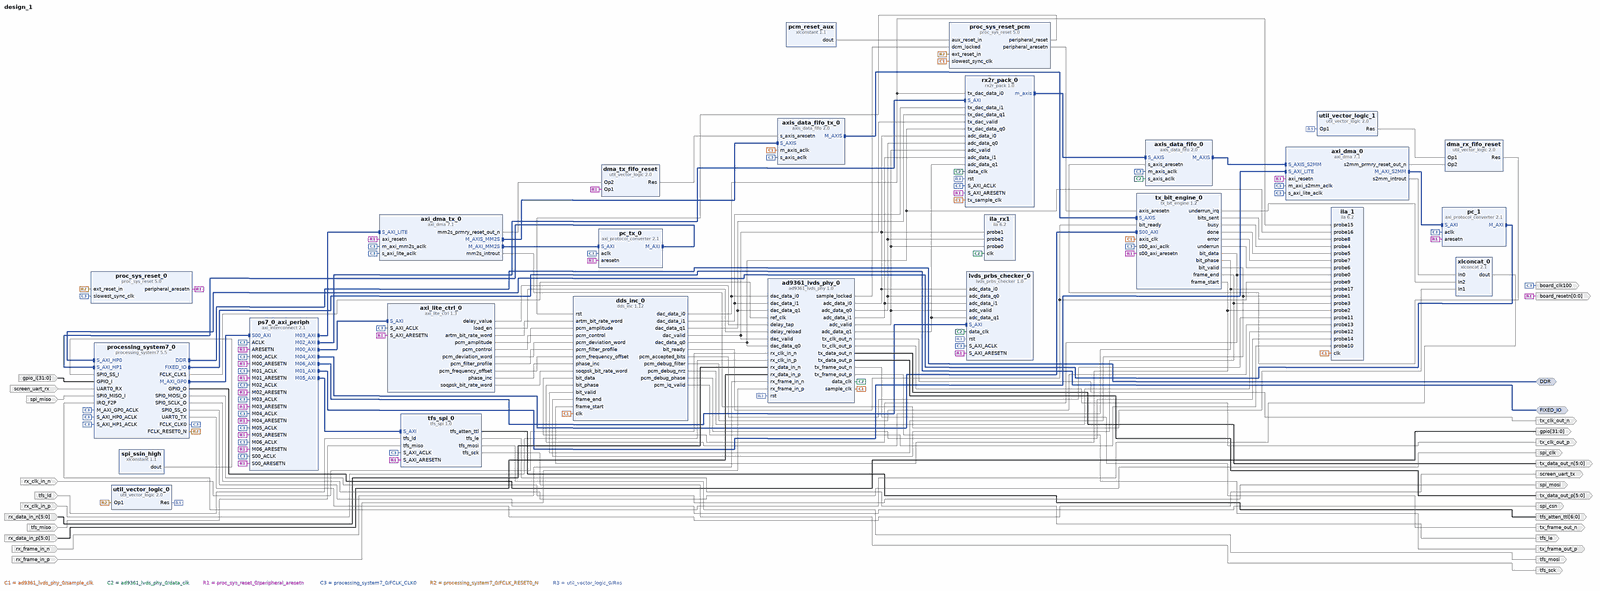
[diagram p0: block diagram of the top level, whole]
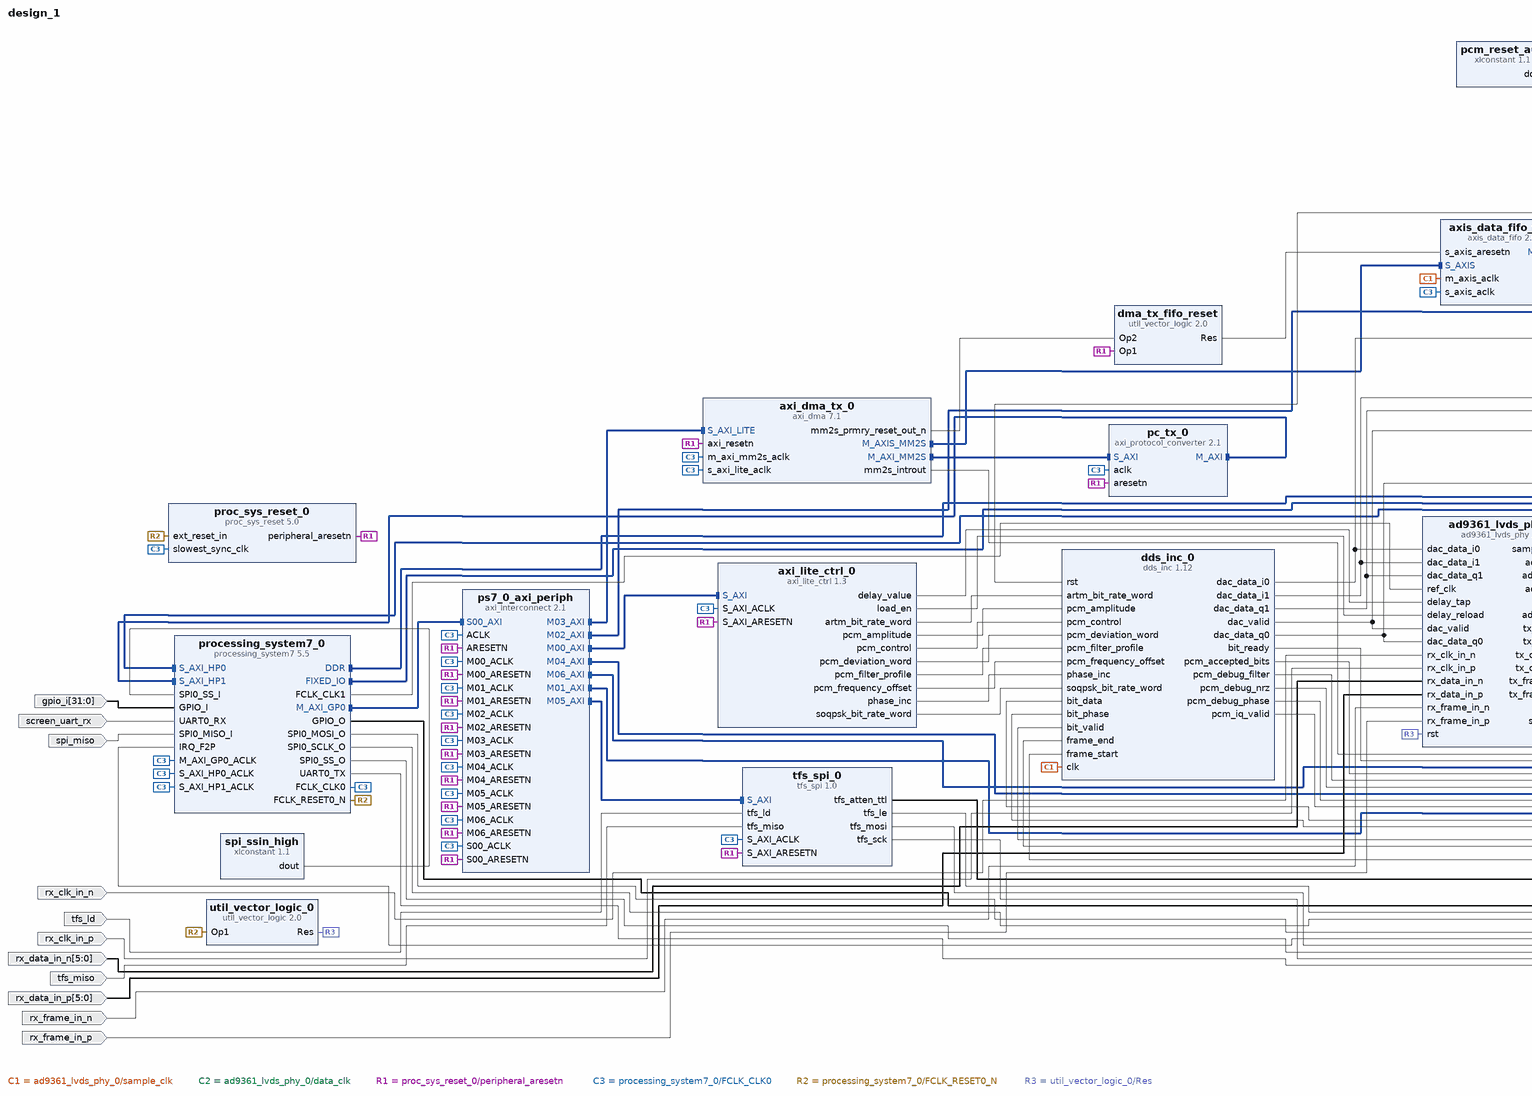
[diagram p1: block diagram of the top level, left part]
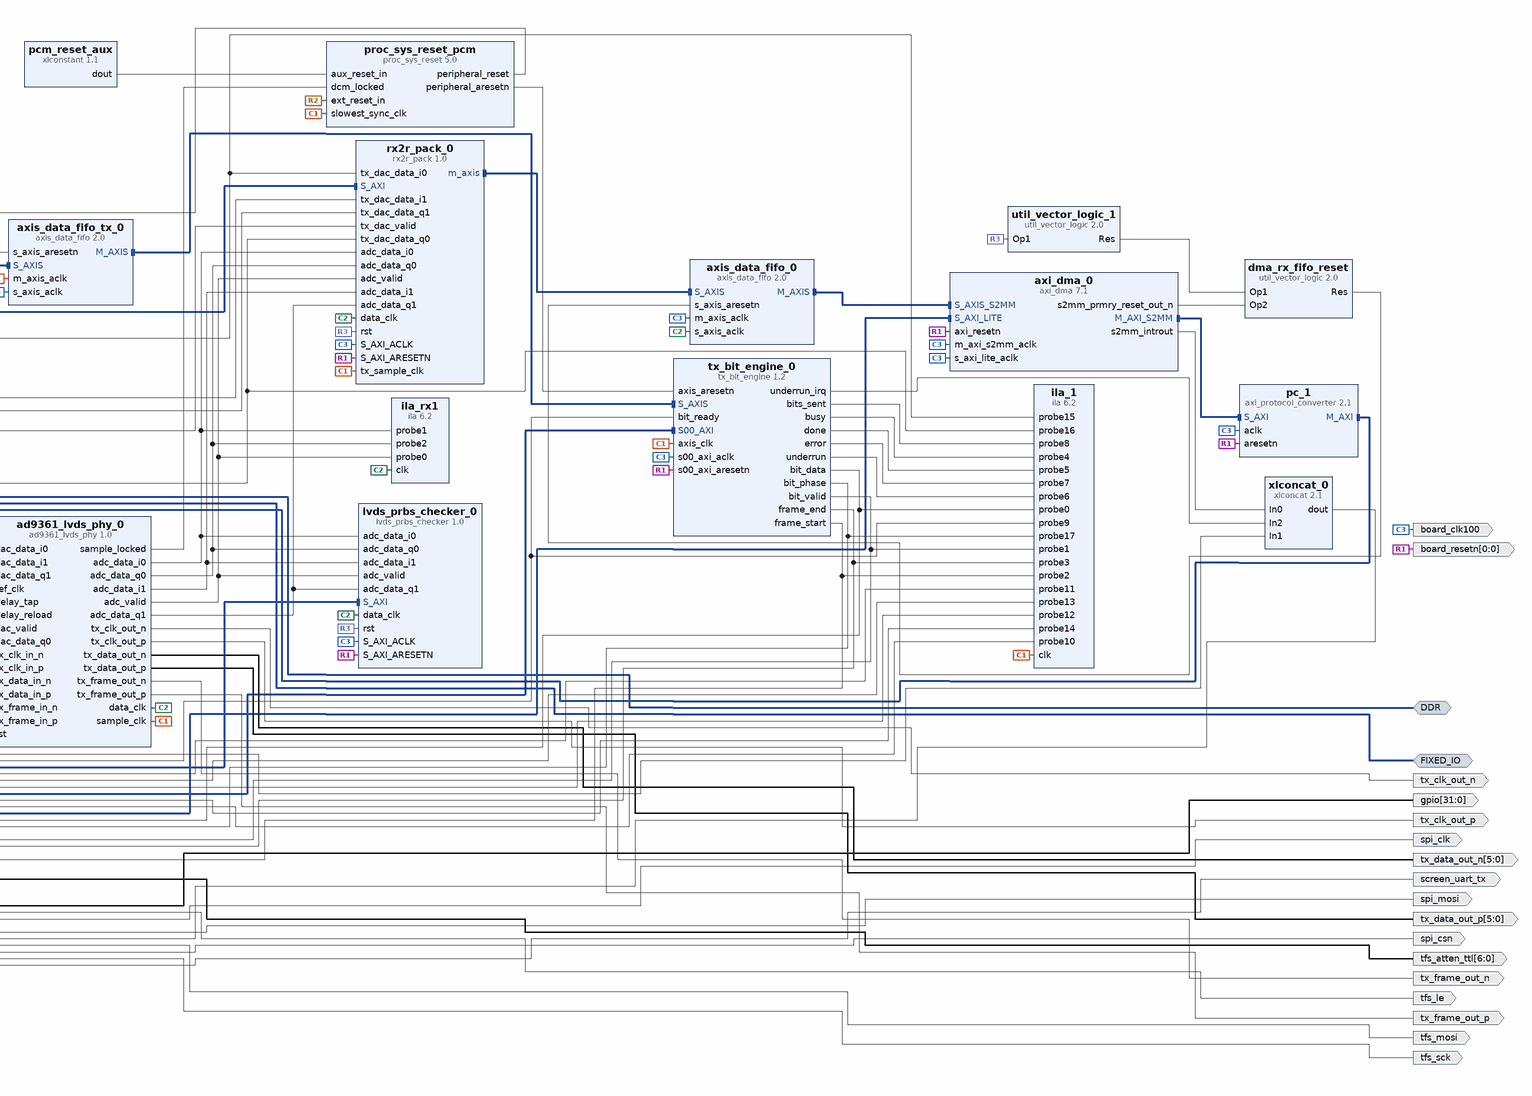
[diagram p2: block diagram of the top level, right part]
# Vivado block design design_1, xc7z035ffg900-2, Vivado 2020.2
create_bd_design design_1

create_bd_intf_port -mode Master -vlnv xilinx.com:interface:ddrx_rtl:1.0 DDR
create_bd_intf_port -mode Master -vlnv xilinx.com:display_processing_system7:fixedio_rtl:1.0 FIXED_IO
create_bd_port -dir O -from 31 -to 0 gpio
create_bd_port -dir I -from 31 -to 0 gpio_i
create_bd_port -dir I rx_clk_in_n
create_bd_port -dir I rx_clk_in_p
create_bd_port -dir I -from 5 -to 0 rx_data_in_n
create_bd_port -dir I -from 5 -to 0 rx_data_in_p
create_bd_port -dir I rx_frame_in_n
create_bd_port -dir I rx_frame_in_p
create_bd_port -dir I screen_uart_rx
create_bd_port -dir O screen_uart_tx
create_bd_port -dir O spi_clk
create_bd_port -dir O spi_csn
create_bd_port -dir I spi_miso
create_bd_port -dir O spi_mosi
create_bd_port -dir O -from 6 -to 0 tfs_atten_ttl
create_bd_port -dir I tfs_ld
create_bd_port -dir O tfs_le
create_bd_port -dir I tfs_miso
create_bd_port -dir O tfs_mosi
create_bd_port -dir O tfs_sck
create_bd_port -dir O tx_clk_out_n
create_bd_port -dir O tx_clk_out_p
create_bd_port -dir O -from 5 -to 0 tx_data_out_n
create_bd_port -dir O -from 5 -to 0 tx_data_out_p
create_bd_port -dir O tx_frame_out_n
create_bd_port -dir O tx_frame_out_p
create_bd_port -dir O -type clk board_clk100
set_property -dict {CONFIG.FREQ_HZ 100000000} [get_bd_ports board_clk100]
create_bd_port -dir O -from 0 -to 0 -type rst board_resetn

create_bd_cell -type ip -vlnv user.org:user:ad9361_lvds_phy:1.0 ad9361_lvds_phy_0
set_property -dict {CONFIG.RX_ENABLE 1} [get_bd_cells ad9361_lvds_phy_0]
create_bd_cell -type ip -vlnv xilinx.com:ip:axi_dma:7.1 axi_dma_0
set_property -dict [list \
  CONFIG.c_include_mm2s 0 \
  CONFIG.c_include_s2mm 1 \
  CONFIG.c_include_sg 0 \
  CONFIG.c_m_axi_s2mm_data_width 64 \
  CONFIG.c_s2mm_burst_size 16 \
  CONFIG.c_s_axis_s2mm_tdata_width 32 \
  CONFIG.c_sg_length_width 26 \
] [get_bd_cells axi_dma_0]
create_bd_cell -type ip -vlnv xilinx.com:ip:axi_dma:7.1 axi_dma_tx_0
set_property -dict [list \
  CONFIG.c_addr_width 32 \
  CONFIG.c_include_mm2s 1 \
  CONFIG.c_include_mm2s_dre 0 \
  CONFIG.c_include_s2mm 0 \
  CONFIG.c_include_sg 0 \
  CONFIG.c_m_axi_mm2s_data_width 64 \
  CONFIG.c_m_axis_mm2s_tdata_width 32 \
  CONFIG.c_mm2s_burst_size 16 \
  CONFIG.c_sg_length_width 26 \
] [get_bd_cells axi_dma_tx_0]
create_bd_cell -type ip -vlnv xilinx.com:user:axi_lite_ctrl:1.3 axi_lite_ctrl_0
create_bd_cell -type ip -vlnv xilinx.com:ip:axis_data_fifo:2.0 axis_data_fifo_0
set_property -dict [list \
  CONFIG.FIFO_DEPTH 16384 \
  CONFIG.HAS_TKEEP 0 \
  CONFIG.HAS_TLAST 1 \
  CONFIG.IS_ACLK_ASYNC 1 \
] [get_bd_cells axis_data_fifo_0]
create_bd_cell -type ip -vlnv xilinx.com:ip:axis_data_fifo:2.0 axis_data_fifo_tx_0
set_property -dict [list \
  CONFIG.FIFO_DEPTH 16384 \
  CONFIG.HAS_TKEEP 1 \
  CONFIG.HAS_TLAST 1 \
  CONFIG.IS_ACLK_ASYNC 1 \
  CONFIG.TDATA_NUM_BYTES 4 \
] [get_bd_cells axis_data_fifo_tx_0]
create_bd_cell -type ip -vlnv xilinx.com:user:dds_inc:1.12 dds_inc_0
create_bd_cell -type ip -vlnv xilinx.com:ip:ila:6.2 ila_1
set_property -dict [list \
  CONFIG.ALL_PROBE_SAME_MU_CNT 2 \
  CONFIG.C_ADV_TRIGGER true \
  CONFIG.C_DATA_DEPTH 2048 \
  CONFIG.C_ENABLE_ILA_AXI_MON false \
  CONFIG.C_EN_STRG_QUAL 1 \
  CONFIG.C_MONITOR_TYPE Native \
  CONFIG.C_NUM_OF_PROBES 18 \
  CONFIG.C_PROBE0_MU_CNT 2 \
  CONFIG.C_PROBE10_WIDTH 1 \
  CONFIG.C_PROBE11_WIDTH 32 \
  CONFIG.C_PROBE12_WIDTH 16 \
  CONFIG.C_PROBE13_WIDTH 16 \
  CONFIG.C_PROBE14_WIDTH 32 \
  CONFIG.C_PROBE15_WIDTH 12 \
  CONFIG.C_PROBE16_WIDTH 12 \
  CONFIG.C_PROBE17_WIDTH 32 \
  CONFIG.C_PROBE18_WIDTH 1 \
  CONFIG.C_PROBE19_WIDTH 1 \
  CONFIG.C_PROBE1_MU_CNT 2 \
  CONFIG.C_PROBE2_MU_CNT 2 \
  CONFIG.C_PROBE3_MU_CNT 2 \
  CONFIG.C_PROBE4_MU_CNT 2 \
  CONFIG.C_PROBE5_MU_CNT 2 \
  CONFIG.C_PROBE6_MU_CNT 2 \
  CONFIG.C_PROBE7_MU_CNT 2 \
  CONFIG.C_PROBE8_MU_CNT 2 \
  CONFIG.C_PROBE8_WIDTH 32 \
  CONFIG.C_PROBE9_WIDTH 1 \
] [get_bd_cells ila_1]
create_bd_cell -type ip -vlnv xilinx.com:ip:ila:6.2 ila_rx1
set_property -dict [list \
  CONFIG.C_DATA_DEPTH 4096 \
  CONFIG.C_EN_STRG_QUAL 1 \
  CONFIG.C_INPUT_PIPE_STAGES 1 \
  CONFIG.C_MONITOR_TYPE Native \
  CONFIG.C_NUM_OF_PROBES 3 \
  CONFIG.C_PROBE0_WIDTH 1 \
  CONFIG.C_PROBE1_WIDTH 12 \
  CONFIG.C_PROBE2_WIDTH 12 \
] [get_bd_cells ila_rx1]
create_bd_cell -type ip -vlnv user.org:user:lvds_prbs_checker:1.0 lvds_prbs_checker_0
create_bd_cell -type ip -vlnv xilinx.com:ip:axi_protocol_converter:2.1 pc_1
set_property -dict {CONFIG.DATA_WIDTH 64 CONFIG.MI_PROTOCOL AXI3 CONFIG.SI_PROTOCOL AXI4} [get_bd_cells pc_1]
create_bd_cell -type ip -vlnv xilinx.com:ip:axi_protocol_converter:2.1 pc_tx_0
set_property -dict [list \
  CONFIG.DATA_WIDTH 64 \
  CONFIG.MI_PROTOCOL AXI3 \
  CONFIG.READ_WRITE_MODE READ_ONLY \
  CONFIG.SI_PROTOCOL AXI4 \
] [get_bd_cells pc_tx_0]
create_bd_cell -type ip -vlnv xilinx.com:ip:xlconstant:1.1 pcm_reset_aux
set_property -dict {CONFIG.CONST_VAL 0 CONFIG.CONST_WIDTH 1} [get_bd_cells pcm_reset_aux]
create_bd_cell -type ip -vlnv xilinx.com:ip:proc_sys_reset:5.0 proc_sys_reset_0
create_bd_cell -type ip -vlnv xilinx.com:ip:proc_sys_reset:5.0 proc_sys_reset_pcm
set_property -dict {CONFIG.C_AUX_RESET_HIGH 1} [get_bd_cells proc_sys_reset_pcm]
create_bd_cell -type ip -vlnv xilinx.com:ip:processing_system7:5.5 processing_system7_0
set_property -dict [list \
  CONFIG.PCW_APU_PERIPHERAL_FREQMHZ 666.666666 \
  CONFIG.PCW_CPU_CPU_6X4X_MAX_RANGE 800 \
  CONFIG.PCW_ENET0_ENET0_IO {MIO 16 .. 27} \
  CONFIG.PCW_ENET0_GRP_MDIO_ENABLE 1 \
  CONFIG.PCW_ENET0_GRP_MDIO_IO {MIO 52 .. 53} \
  CONFIG.PCW_ENET0_PERIPHERAL_ENABLE 1 \
  CONFIG.PCW_ENET0_RESET_ENABLE 0 \
  CONFIG.PCW_ENET_RESET_ENABLE 1 \
  CONFIG.PCW_ENET_RESET_SELECT {Share reset pin} \
  CONFIG.PCW_EN_CLK1_PORT 1 \
  CONFIG.PCW_EN_CLK2_PORT 1 \
  CONFIG.PCW_FCLK_CLK1_BUF TRUE \
  CONFIG.PCW_FCLK_CLK2_BUF TRUE \
  CONFIG.PCW_FPGA0_PERIPHERAL_FREQMHZ 100 \
  CONFIG.PCW_FPGA1_PERIPHERAL_FREQMHZ 200 \
  CONFIG.PCW_FPGA2_PERIPHERAL_FREQMHZ 250 \
  CONFIG.PCW_FPGA_FCLK1_ENABLE 1 \
  CONFIG.PCW_FPGA_FCLK2_ENABLE 1 \
  CONFIG.PCW_GPIO_EMIO_GPIO_ENABLE 1 \
  CONFIG.PCW_GPIO_EMIO_GPIO_IO 32 \
  CONFIG.PCW_GPIO_EMIO_GPIO_WIDTH 32 \
  CONFIG.PCW_GPIO_MIO_GPIO_ENABLE 1 \
  CONFIG.PCW_GPIO_MIO_GPIO_IO MIO \
  CONFIG.PCW_I2C_RESET_ENABLE 0 \
  CONFIG.PCW_IRQ_F2P_INTR 1 \
  CONFIG.PCW_PERIPHERAL_BOARD_PRESET None \
  CONFIG.PCW_PRESET_BANK1_VOLTAGE {LVCMOS 1.8V} \
  CONFIG.PCW_QSPI_GRP_SINGLE_SS_ENABLE 1 \
  CONFIG.PCW_QSPI_GRP_SINGLE_SS_IO {MIO 1 .. 6} \
  CONFIG.PCW_QSPI_PERIPHERAL_ENABLE 1 \
  CONFIG.PCW_QSPI_QSPI_IO {MIO 1 .. 6} \
  CONFIG.PCW_SD0_PERIPHERAL_ENABLE 0 \
  CONFIG.PCW_SINGLE_QSPI_DATA_MODE x4 \
  CONFIG.PCW_SPI0_PERIPHERAL_ENABLE 1 \
  CONFIG.PCW_SPI0_SPI0_IO EMIO \
  CONFIG.PCW_UART0_PERIPHERAL_ENABLE 1 \
  CONFIG.PCW_UART0_UART0_IO EMIO \
  CONFIG.PCW_UART1_PERIPHERAL_ENABLE 1 \
  CONFIG.PCW_UART1_UART1_IO {MIO 48 .. 49} \
  CONFIG.PCW_UART_PERIPHERAL_FREQMHZ 100 \
  CONFIG.PCW_UIPARAM_DDR_FREQ_MHZ 533.333333 \
  CONFIG.PCW_UIPARAM_DDR_PARTNO {MT41K256M16 RE-125} \
  CONFIG.PCW_USB0_PERIPHERAL_ENABLE 0 \
  CONFIG.PCW_USB_RESET_ENABLE 1 \
  CONFIG.PCW_USE_FABRIC_INTERRUPT 1 \
  CONFIG.PCW_USE_S_AXI_HP0 1 \
  CONFIG.PCW_USE_S_AXI_HP1 1 \
] [get_bd_cells processing_system7_0]
# 509 more settings of processing_system7_0 are not shown: defaults, MIO pin electricals, DDR timing, and values the tool derives
create_bd_cell -type ip -vlnv xilinx.com:ip:axi_interconnect:2.1 ps7_0_axi_periph
set_property -dict {CONFIG.NUM_MI 7} [get_bd_cells ps7_0_axi_periph]
create_bd_cell -type ip -vlnv xilinx.com:user:tfs_spi:1.0 tfs_spi_0
create_bd_cell -type ip -vlnv user.org:user:tx_bit_engine:1.2 tx_bit_engine_0
set_property -dict {CONFIG.AXIS_CLK_HZ 61440000} [get_bd_cells tx_bit_engine_0]
create_bd_cell -type ip -vlnv xilinx.com:ip:util_vector_logic:2.0 util_vector_logic_0
set_property -dict {CONFIG.C_OPERATION not CONFIG.C_SIZE 1} [get_bd_cells util_vector_logic_0]
create_bd_cell -type ip -vlnv xilinx.com:ip:util_vector_logic:2.0 util_vector_logic_1
set_property -dict {CONFIG.C_OPERATION not CONFIG.C_SIZE 1} [get_bd_cells util_vector_logic_1]
create_bd_cell -type ip -vlnv xilinx.com:ip:xlconcat:2.1 xlconcat_0
set_property -dict {CONFIG.NUM_PORTS 3} [get_bd_cells xlconcat_0]
create_bd_cell -type ip -vlnv xilinx.com:ip:xlconstant:1.1 spi_ssin_high
set_property -dict {CONFIG.CONST_VAL 1 CONFIG.CONST_WIDTH 1} [get_bd_cells spi_ssin_high]
create_bd_cell -type ip -vlnv xilinx.com:user:rx2r_pack:1.0 rx2r_pack_0
set_property -dict {CONFIG.TX_ONLY 0} [get_bd_cells rx2r_pack_0]
create_bd_cell -type ip -vlnv xilinx.com:ip:util_vector_logic:2.0 dma_rx_fifo_reset
set_property -dict {CONFIG.C_OPERATION and CONFIG.C_SIZE 1} [get_bd_cells dma_rx_fifo_reset]
create_bd_cell -type ip -vlnv xilinx.com:ip:util_vector_logic:2.0 dma_tx_fifo_reset
set_property -dict {CONFIG.C_OPERATION and CONFIG.C_SIZE 1} [get_bd_cells dma_tx_fifo_reset]

# ---- connections ----

connect_bd_intf_net [get_bd_intf_ports DDR] [get_bd_intf_pins processing_system7_0/DDR]
connect_bd_intf_net [get_bd_intf_ports FIXED_IO] [get_bd_intf_pins processing_system7_0/FIXED_IO]
connect_bd_intf_net [get_bd_intf_pins ps7_0_axi_periph/M04_AXI] [get_bd_intf_pins tx_bit_engine_0/S00_AXI]
connect_bd_intf_net [get_bd_intf_pins axi_dma_0/M_AXI_S2MM] [get_bd_intf_pins pc_1/S_AXI]
connect_bd_intf_net [get_bd_intf_pins axi_dma_tx_0/M_AXIS_MM2S] [get_bd_intf_pins axis_data_fifo_tx_0/S_AXIS]
connect_bd_intf_net [get_bd_intf_pins pc_tx_0/M_AXI] [get_bd_intf_pins processing_system7_0/S_AXI_HP1]
connect_bd_intf_net -intf_net auto_pc_1_M_AXI [get_bd_intf_pins pc_1/M_AXI] [get_bd_intf_pins processing_system7_0/S_AXI_HP0]
connect_bd_intf_net [get_bd_intf_pins axi_dma_tx_0/S_AXI_LITE] [get_bd_intf_pins ps7_0_axi_periph/M03_AXI]
connect_bd_intf_net [get_bd_intf_pins axi_dma_tx_0/M_AXI_MM2S] [get_bd_intf_pins pc_tx_0/S_AXI]
connect_bd_intf_net [get_bd_intf_pins processing_system7_0/M_AXI_GP0] [get_bd_intf_pins ps7_0_axi_periph/S00_AXI]
connect_bd_intf_net [get_bd_intf_pins lvds_prbs_checker_0/S_AXI] [get_bd_intf_pins ps7_0_axi_periph/M06_AXI]
connect_bd_intf_net [get_bd_intf_pins ps7_0_axi_periph/M02_AXI] [get_bd_intf_pins rx2r_pack_0/S_AXI]
connect_bd_intf_net [get_bd_intf_pins ps7_0_axi_periph/M05_AXI] [get_bd_intf_pins tfs_spi_0/S_AXI]
connect_bd_intf_net [get_bd_intf_pins axi_dma_0/S_AXIS_S2MM] [get_bd_intf_pins axis_data_fifo_0/M_AXIS]
connect_bd_intf_net [get_bd_intf_pins axi_lite_ctrl_0/S_AXI] [get_bd_intf_pins ps7_0_axi_periph/M00_AXI]
connect_bd_intf_net [get_bd_intf_pins axis_data_fifo_0/S_AXIS] [get_bd_intf_pins rx2r_pack_0/m_axis]
connect_bd_intf_net [get_bd_intf_pins axis_data_fifo_tx_0/M_AXIS] [get_bd_intf_pins tx_bit_engine_0/S_AXIS]
connect_bd_intf_net [get_bd_intf_pins axi_dma_0/S_AXI_LITE] [get_bd_intf_pins ps7_0_axi_periph/M01_AXI]
connect_bd_net [get_bd_pins ad9361_lvds_phy_0/sample_clk] \
  [get_bd_pins axis_data_fifo_tx_0/m_axis_aclk] [get_bd_pins dds_inc_0/clk] [get_bd_pins ila_1/clk] \
  [get_bd_pins proc_sys_reset_pcm/slowest_sync_clk] [get_bd_pins tx_bit_engine_0/axis_clk] \
  [get_bd_pins rx2r_pack_0/tx_sample_clk]
connect_bd_net [get_bd_pins ad9361_lvds_phy_0/sample_locked] [get_bd_pins proc_sys_reset_pcm/dcm_locked]
connect_bd_net [get_bd_pins ad9361_lvds_phy_0/tx_clk_out_n] [get_bd_ports tx_clk_out_n]
connect_bd_net [get_bd_pins ad9361_lvds_phy_0/tx_clk_out_p] [get_bd_ports tx_clk_out_p]
connect_bd_net [get_bd_pins ad9361_lvds_phy_0/tx_data_out_n] [get_bd_ports tx_data_out_n]
connect_bd_net [get_bd_pins ad9361_lvds_phy_0/tx_data_out_p] [get_bd_ports tx_data_out_p]
connect_bd_net [get_bd_pins ad9361_lvds_phy_0/tx_frame_out_n] [get_bd_ports tx_frame_out_n]
connect_bd_net [get_bd_pins ad9361_lvds_phy_0/tx_frame_out_p] [get_bd_ports tx_frame_out_p]
connect_bd_net -net ad9363_lvds_if_0_data_clk [get_bd_pins ad9361_lvds_phy_0/data_clk] \
  [get_bd_pins axis_data_fifo_0/s_axis_aclk] [get_bd_pins ila_rx1/clk] [get_bd_pins lvds_prbs_checker_0/data_clk] \
  [get_bd_pins rx2r_pack_0/data_clk]
connect_bd_net -net ad9363_phy_0_adc_data_i0 [get_bd_pins ad9361_lvds_phy_0/adc_data_i0] \
  [get_bd_pins ila_rx1/probe1] [get_bd_pins lvds_prbs_checker_0/adc_data_i0] [get_bd_pins rx2r_pack_0/adc_data_i0]
connect_bd_net -net ad9363_phy_0_adc_data_i1 [get_bd_pins ad9361_lvds_phy_0/adc_data_i1] \
  [get_bd_pins lvds_prbs_checker_0/adc_data_i1] [get_bd_pins rx2r_pack_0/adc_data_i1]
connect_bd_net -net ad9363_phy_0_adc_data_q0 [get_bd_pins ad9361_lvds_phy_0/adc_data_q0] \
  [get_bd_pins ila_rx1/probe2] [get_bd_pins lvds_prbs_checker_0/adc_data_q0] [get_bd_pins rx2r_pack_0/adc_data_q0]
connect_bd_net -net ad9363_phy_0_adc_data_q1 [get_bd_pins ad9361_lvds_phy_0/adc_data_q1] \
  [get_bd_pins lvds_prbs_checker_0/adc_data_q1] [get_bd_pins rx2r_pack_0/adc_data_q1]
connect_bd_net -net ad9363_phy_0_adc_valid [get_bd_pins ad9361_lvds_phy_0/adc_valid] \
  [get_bd_pins ila_rx1/probe0] [get_bd_pins lvds_prbs_checker_0/adc_valid] [get_bd_pins rx2r_pack_0/adc_valid]
connect_bd_net [get_bd_pins axi_dma_0/s2mm_introut] [get_bd_pins xlconcat_0/In0]
connect_bd_net [get_bd_pins axi_dma_tx_0/mm2s_introut] [get_bd_pins xlconcat_0/In1]
connect_bd_net [get_bd_pins axi_lite_ctrl_0/artm_bit_rate_word] [get_bd_pins dds_inc_0/artm_bit_rate_word]
connect_bd_net [get_bd_pins axi_lite_ctrl_0/delay_value] [get_bd_pins ad9361_lvds_phy_0/delay_tap]
connect_bd_net [get_bd_pins axi_lite_ctrl_0/load_en] [get_bd_pins ad9361_lvds_phy_0/delay_reload]
connect_bd_net [get_bd_pins axi_lite_ctrl_0/pcm_amplitude] [get_bd_pins dds_inc_0/pcm_amplitude]
connect_bd_net [get_bd_pins axi_lite_ctrl_0/pcm_control] [get_bd_pins dds_inc_0/pcm_control]
connect_bd_net [get_bd_pins axi_lite_ctrl_0/pcm_deviation_word] [get_bd_pins dds_inc_0/pcm_deviation_word]
connect_bd_net [get_bd_pins axi_lite_ctrl_0/pcm_filter_profile] [get_bd_pins dds_inc_0/pcm_filter_profile]
connect_bd_net [get_bd_pins axi_lite_ctrl_0/pcm_frequency_offset] [get_bd_pins dds_inc_0/pcm_frequency_offset]
connect_bd_net [get_bd_pins axi_lite_ctrl_0/phase_inc] [get_bd_pins dds_inc_0/phase_inc]
connect_bd_net [get_bd_pins axi_lite_ctrl_0/soqpsk_bit_rate_word] [get_bd_pins dds_inc_0/soqpsk_bit_rate_word]
connect_bd_net [get_bd_pins dds_inc_0/bit_ready] [get_bd_pins ila_1/probe9] [get_bd_pins tx_bit_engine_0/bit_ready]
connect_bd_net [get_bd_pins dds_inc_0/dac_data_i0] \
  [get_bd_pins ad9361_lvds_phy_0/dac_data_i0] [get_bd_pins ila_1/probe15] [get_bd_pins rx2r_pack_0/tx_dac_data_i0]
connect_bd_net [get_bd_pins dds_inc_0/dac_data_i1] [get_bd_pins ad9361_lvds_phy_0/dac_data_i1] [get_bd_pins rx2r_pack_0/tx_dac_data_i1]
connect_bd_net [get_bd_pins dds_inc_0/dac_data_q0] \
  [get_bd_pins ad9361_lvds_phy_0/dac_data_q0] [get_bd_pins ila_1/probe16] [get_bd_pins rx2r_pack_0/tx_dac_data_q0]
connect_bd_net [get_bd_pins dds_inc_0/dac_data_q1] [get_bd_pins ad9361_lvds_phy_0/dac_data_q1] [get_bd_pins rx2r_pack_0/tx_dac_data_q1]
connect_bd_net [get_bd_pins dds_inc_0/dac_valid] [get_bd_pins ad9361_lvds_phy_0/dac_valid] [get_bd_pins rx2r_pack_0/tx_dac_valid]
connect_bd_net [get_bd_pins dds_inc_0/pcm_accepted_bits] [get_bd_pins ila_1/probe11]
connect_bd_net [get_bd_pins dds_inc_0/pcm_debug_filter] [get_bd_pins ila_1/probe13]
connect_bd_net [get_bd_pins dds_inc_0/pcm_debug_nrz] [get_bd_pins ila_1/probe12]
connect_bd_net [get_bd_pins dds_inc_0/pcm_debug_phase] [get_bd_pins ila_1/probe14]
connect_bd_net [get_bd_pins dds_inc_0/pcm_iq_valid] [get_bd_pins ila_1/probe10]
connect_bd_net [get_bd_ports gpio_i] [get_bd_pins processing_system7_0/GPIO_I]
connect_bd_net [get_bd_pins pcm_reset_aux/dout] [get_bd_pins proc_sys_reset_pcm/aux_reset_in]
connect_bd_net [get_bd_pins proc_sys_reset_0/peripheral_aresetn] \
  [get_bd_pins axi_dma_0/axi_resetn] [get_bd_pins axi_dma_tx_0/axi_resetn] [get_bd_pins axi_lite_ctrl_0/S_AXI_ARESETN] \
  [get_bd_pins lvds_prbs_checker_0/S_AXI_ARESETN] [get_bd_pins pc_1/aresetn] [get_bd_pins pc_tx_0/aresetn] \
  [get_bd_pins ps7_0_axi_periph/ARESETN] [get_bd_pins ps7_0_axi_periph/M00_ARESETN] \
  [get_bd_pins ps7_0_axi_periph/M01_ARESETN] [get_bd_pins ps7_0_axi_periph/M02_ARESETN] \
  [get_bd_pins ps7_0_axi_periph/M03_ARESETN] [get_bd_pins ps7_0_axi_periph/M04_ARESETN] \
  [get_bd_pins ps7_0_axi_periph/M05_ARESETN] [get_bd_pins ps7_0_axi_periph/M06_ARESETN] \
  [get_bd_pins ps7_0_axi_periph/S00_ARESETN] [get_bd_pins tfs_spi_0/S_AXI_ARESETN] \
  [get_bd_pins tx_bit_engine_0/s00_axi_aresetn] [get_bd_ports board_resetn] [get_bd_pins rx2r_pack_0/S_AXI_ARESETN] \
  [get_bd_pins dma_tx_fifo_reset/Op1]
connect_bd_net [get_bd_pins proc_sys_reset_pcm/peripheral_aresetn] [get_bd_pins tx_bit_engine_0/axis_aresetn]
connect_bd_net [get_bd_pins proc_sys_reset_pcm/peripheral_reset] [get_bd_pins dds_inc_0/rst]
connect_bd_net [get_bd_pins processing_system7_0/FCLK_CLK0] \
  [get_bd_pins axi_dma_0/m_axi_s2mm_aclk] [get_bd_pins axi_dma_0/s_axi_lite_aclk] [get_bd_pins axi_dma_tx_0/m_axi_mm2s_aclk] \
  [get_bd_pins axi_dma_tx_0/s_axi_lite_aclk] [get_bd_pins axi_lite_ctrl_0/S_AXI_ACLK] \
  [get_bd_pins axis_data_fifo_0/m_axis_aclk] [get_bd_pins axis_data_fifo_tx_0/s_axis_aclk] \
  [get_bd_pins lvds_prbs_checker_0/S_AXI_ACLK] [get_bd_pins pc_1/aclk] [get_bd_pins pc_tx_0/aclk] \
  [get_bd_pins proc_sys_reset_0/slowest_sync_clk] [get_bd_pins processing_system7_0/M_AXI_GP0_ACLK] \
  [get_bd_pins processing_system7_0/S_AXI_HP0_ACLK] [get_bd_pins processing_system7_0/S_AXI_HP1_ACLK] \
  [get_bd_pins ps7_0_axi_periph/ACLK] [get_bd_pins ps7_0_axi_periph/M00_ACLK] [get_bd_pins ps7_0_axi_periph/M01_ACLK] \
  [get_bd_pins ps7_0_axi_periph/M02_ACLK] [get_bd_pins ps7_0_axi_periph/M03_ACLK] [get_bd_pins ps7_0_axi_periph/M04_ACLK] \
  [get_bd_pins ps7_0_axi_periph/M05_ACLK] [get_bd_pins ps7_0_axi_periph/M06_ACLK] [get_bd_pins ps7_0_axi_periph/S00_ACLK] \
  [get_bd_pins tfs_spi_0/S_AXI_ACLK] [get_bd_pins tx_bit_engine_0/s00_axi_aclk] [get_bd_ports board_clk100] \
  [get_bd_pins rx2r_pack_0/S_AXI_ACLK]
connect_bd_net [get_bd_pins processing_system7_0/FCLK_CLK1] [get_bd_pins ad9361_lvds_phy_0/ref_clk]
connect_bd_net [get_bd_pins processing_system7_0/FCLK_RESET0_N] \
  [get_bd_pins proc_sys_reset_0/ext_reset_in] [get_bd_pins proc_sys_reset_pcm/ext_reset_in] \
  [get_bd_pins util_vector_logic_0/Op1]
connect_bd_net [get_bd_pins processing_system7_0/GPIO_O] [get_bd_ports gpio]
connect_bd_net [get_bd_pins processing_system7_0/SPI0_MOSI_O] [get_bd_ports spi_mosi]
connect_bd_net [get_bd_pins processing_system7_0/SPI0_SCLK_O] [get_bd_ports spi_clk]
connect_bd_net [get_bd_pins processing_system7_0/SPI0_SS_O] [get_bd_ports spi_csn]
connect_bd_net [get_bd_pins processing_system7_0/UART0_TX] [get_bd_ports screen_uart_tx]
connect_bd_net [get_bd_ports rx_clk_in_n] [get_bd_pins ad9361_lvds_phy_0/rx_clk_in_n]
connect_bd_net [get_bd_ports rx_clk_in_p] [get_bd_pins ad9361_lvds_phy_0/rx_clk_in_p]
connect_bd_net [get_bd_ports rx_data_in_n] [get_bd_pins ad9361_lvds_phy_0/rx_data_in_n]
connect_bd_net [get_bd_ports rx_data_in_p] [get_bd_pins ad9361_lvds_phy_0/rx_data_in_p]
connect_bd_net [get_bd_ports rx_frame_in_n] [get_bd_pins ad9361_lvds_phy_0/rx_frame_in_n]
connect_bd_net [get_bd_ports rx_frame_in_p] [get_bd_pins ad9361_lvds_phy_0/rx_frame_in_p]
connect_bd_net [get_bd_ports screen_uart_rx] [get_bd_pins processing_system7_0/UART0_RX]
connect_bd_net [get_bd_ports spi_miso] [get_bd_pins processing_system7_0/SPI0_MISO_I]
connect_bd_net [get_bd_ports tfs_ld] [get_bd_pins tfs_spi_0/tfs_ld]
connect_bd_net [get_bd_ports tfs_miso] [get_bd_pins tfs_spi_0/tfs_miso]
connect_bd_net [get_bd_pins tfs_spi_0/tfs_atten_ttl] [get_bd_ports tfs_atten_ttl]
connect_bd_net [get_bd_pins tfs_spi_0/tfs_le] [get_bd_ports tfs_le]
connect_bd_net [get_bd_pins tfs_spi_0/tfs_mosi] [get_bd_ports tfs_mosi]
connect_bd_net [get_bd_pins tfs_spi_0/tfs_sck] [get_bd_ports tfs_sck]
connect_bd_net [get_bd_pins tx_bit_engine_0/bit_data] [get_bd_pins dds_inc_0/bit_data] [get_bd_pins ila_1/probe0]
connect_bd_net [get_bd_pins tx_bit_engine_0/bit_phase] [get_bd_pins dds_inc_0/bit_phase] [get_bd_pins ila_1/probe17]
connect_bd_net [get_bd_pins tx_bit_engine_0/bit_valid] [get_bd_pins dds_inc_0/bit_valid] [get_bd_pins ila_1/probe1]
connect_bd_net [get_bd_pins tx_bit_engine_0/bits_sent] [get_bd_pins ila_1/probe8]
connect_bd_net [get_bd_pins tx_bit_engine_0/busy] [get_bd_pins ila_1/probe4]
connect_bd_net [get_bd_pins tx_bit_engine_0/done] [get_bd_pins ila_1/probe5]
connect_bd_net [get_bd_pins tx_bit_engine_0/error] [get_bd_pins ila_1/probe7]
connect_bd_net [get_bd_pins tx_bit_engine_0/frame_end] [get_bd_pins dds_inc_0/frame_end] [get_bd_pins ila_1/probe3]
connect_bd_net [get_bd_pins tx_bit_engine_0/frame_start] [get_bd_pins dds_inc_0/frame_start] [get_bd_pins ila_1/probe2]
connect_bd_net [get_bd_pins tx_bit_engine_0/underrun] [get_bd_pins ila_1/probe6]
connect_bd_net [get_bd_pins tx_bit_engine_0/underrun_irq] [get_bd_pins xlconcat_0/In2]
connect_bd_net [get_bd_pins util_vector_logic_0/Res] \
  [get_bd_pins ad9361_lvds_phy_0/rst] [get_bd_pins lvds_prbs_checker_0/rst] [get_bd_pins util_vector_logic_1/Op1] \
  [get_bd_pins rx2r_pack_0/rst]
connect_bd_net [get_bd_pins util_vector_logic_1/Res] [get_bd_pins dma_rx_fifo_reset/Op1]
connect_bd_net [get_bd_pins xlconcat_0/dout] [get_bd_pins processing_system7_0/IRQ_F2P]
connect_bd_net [get_bd_pins spi_ssin_high/dout] [get_bd_pins processing_system7_0/SPI0_SS_I]
connect_bd_net [get_bd_pins axi_dma_0/s2mm_prmry_reset_out_n] [get_bd_pins dma_rx_fifo_reset/Op2]
connect_bd_net [get_bd_pins dma_rx_fifo_reset/Res] [get_bd_pins axis_data_fifo_0/s_axis_aresetn]
connect_bd_net [get_bd_pins axi_dma_tx_0/mm2s_prmry_reset_out_n] [get_bd_pins dma_tx_fifo_reset/Op2]
connect_bd_net [get_bd_pins dma_tx_fifo_reset/Res] [get_bd_pins axis_data_fifo_tx_0/s_axis_aresetn]

# ---- address map ----
assign_bd_address -offset 0x00000000 -range 1G -target_address_space [get_bd_addr_spaces axi_dma_0/Data_S2MM] [get_bd_addr_segs processing_system7_0/S_AXI_HP0/HP0_DDR_LOWOCM]
assign_bd_address -offset 0x00000000 -range 1G -target_address_space [get_bd_addr_spaces axi_dma_tx_0/Data_MM2S] [get_bd_addr_segs processing_system7_0/S_AXI_HP1/HP1_DDR_LOWOCM]
assign_bd_address -offset 0x40400000 -range 64K -target_address_space [get_bd_addr_spaces processing_system7_0/Data] [get_bd_addr_segs axi_dma_0/S_AXI_LITE/Reg]
assign_bd_address -offset 0x40410000 -range 64K -target_address_space [get_bd_addr_spaces processing_system7_0/Data] [get_bd_addr_segs axi_dma_tx_0/S_AXI_LITE/Reg]
assign_bd_address -offset 0x43C00000 -range 64K -target_address_space [get_bd_addr_spaces processing_system7_0/Data] [get_bd_addr_segs axi_lite_ctrl_0/S_AXI/reg0]
assign_bd_address -offset 0x43C10000 -range 64K -target_address_space [get_bd_addr_spaces processing_system7_0/Data] [get_bd_addr_segs rx2r_pack_0/S_AXI/reg0]
assign_bd_address -offset 0x43C20000 -range 64K -target_address_space [get_bd_addr_spaces processing_system7_0/Data] [get_bd_addr_segs tx_bit_engine_0/s00_axi/reg0]
assign_bd_address -offset 0x43C30000 -range 64K -target_address_space [get_bd_addr_spaces processing_system7_0/Data] [get_bd_addr_segs lvds_prbs_checker_0/S_AXI/reg0]
assign_bd_address -offset 0x43C40000 -range 64K -target_address_space [get_bd_addr_spaces processing_system7_0/Data] [get_bd_addr_segs tfs_spi_0/S_AXI/reg0]

validate_bd_design
save_bd_design
